# Altium schematic sheet Battery_Section.SchDoc
size A4; DocumentNumber: 2; SheetNumber: 2; SheetTotal: 13
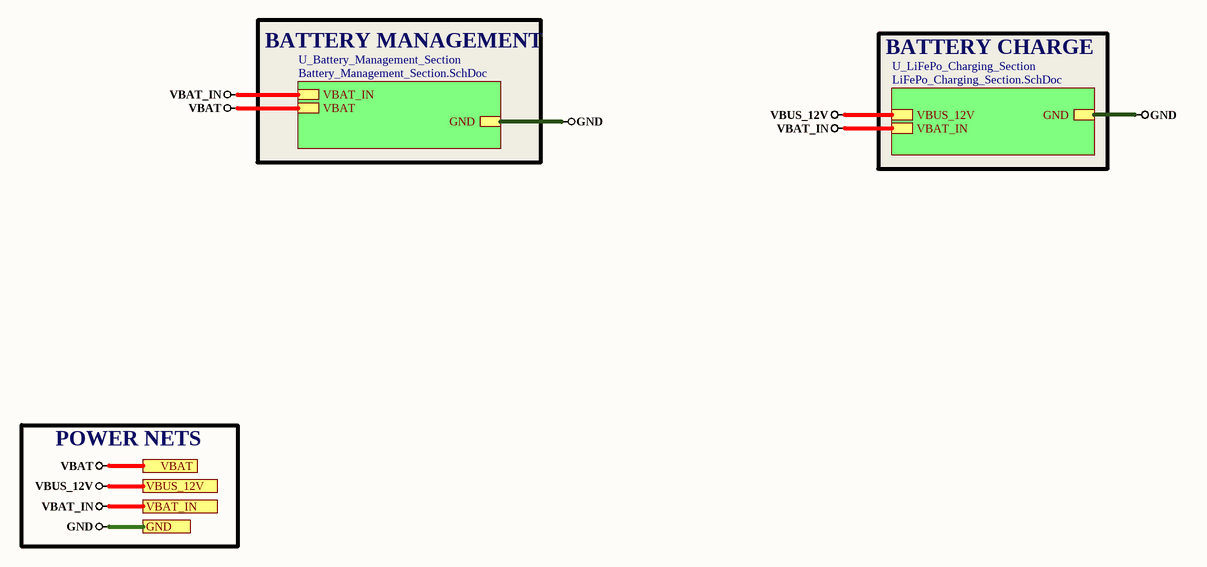
[diagram p0: Battery_Section.SchDoc]

## Sub-sheets
U_Battery_Management_Section = Battery_Management_Section.SchDoc: GND, VBAT, VBAT_IN
U_LiFePo_Charging_Section = LiFePo_Charging_Section.SchDoc: GND, VBUS_12V, VBAT_IN

## Ports
GND, VBAT, VBAT_IN, VBUS_12V

## Nets
GND: port GND, sheet U_Battery_Management_Section/GND, sheet U_LiFePo_Charging_Section/GND
VBAT: port VBAT, sheet U_Battery_Management_Section/VBAT
VBAT_IN: port VBAT_IN, sheet U_Battery_Management_Section/VBAT_IN, sheet U_LiFePo_Charging_Section/VBAT_IN
VBUS_12V: port VBUS_12V, sheet U_LiFePo_Charging_Section/VBUS_12V

## Notes on the sheet
- BATTERY MANAGEMENT
- BATTERY CHARGE
- POWER NETS